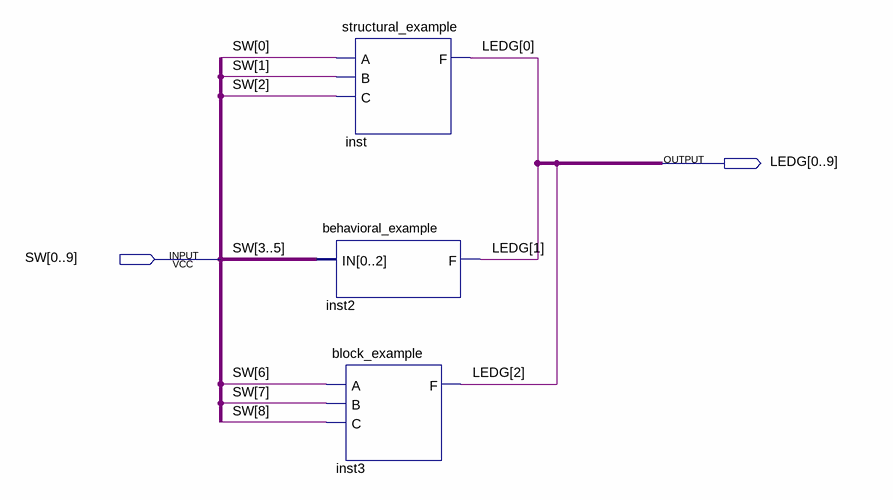
[diagram p0: schematic sheet]
// Quartus schematic lab5sample.bdf as structural Verilog: 3 symbols, 2 pins
module lab5sample (
  input  [0:9] SW,
  output [0:9] LEDG
);

  structural_example inst (.A(SW[0]), .B(SW[1]), .C(SW[2]), .F(LEDG[0]));
  behavioral_example inst2 (.IN(SW[3:5]), .F(LEDG[1]));
  block_example inst3 (.A(SW[6]), .B(SW[7]), .C(SW[8]), .F(LEDG[2]));
endmodule
